# EasyEDA Pro project base-carrier-v0.2.epro

# Schematic Base Carrier

## Sheets
1 Power-External: Board Name: Board1; Create Date: 2026-06-24; Page Name: Power-External; Project Name: ThesadaCore-v1; Schematic Name: CarrierBoard; Update Date: 2026-07-22; Company: EasyEDA.com; Page Size: A4; Version: V1.0
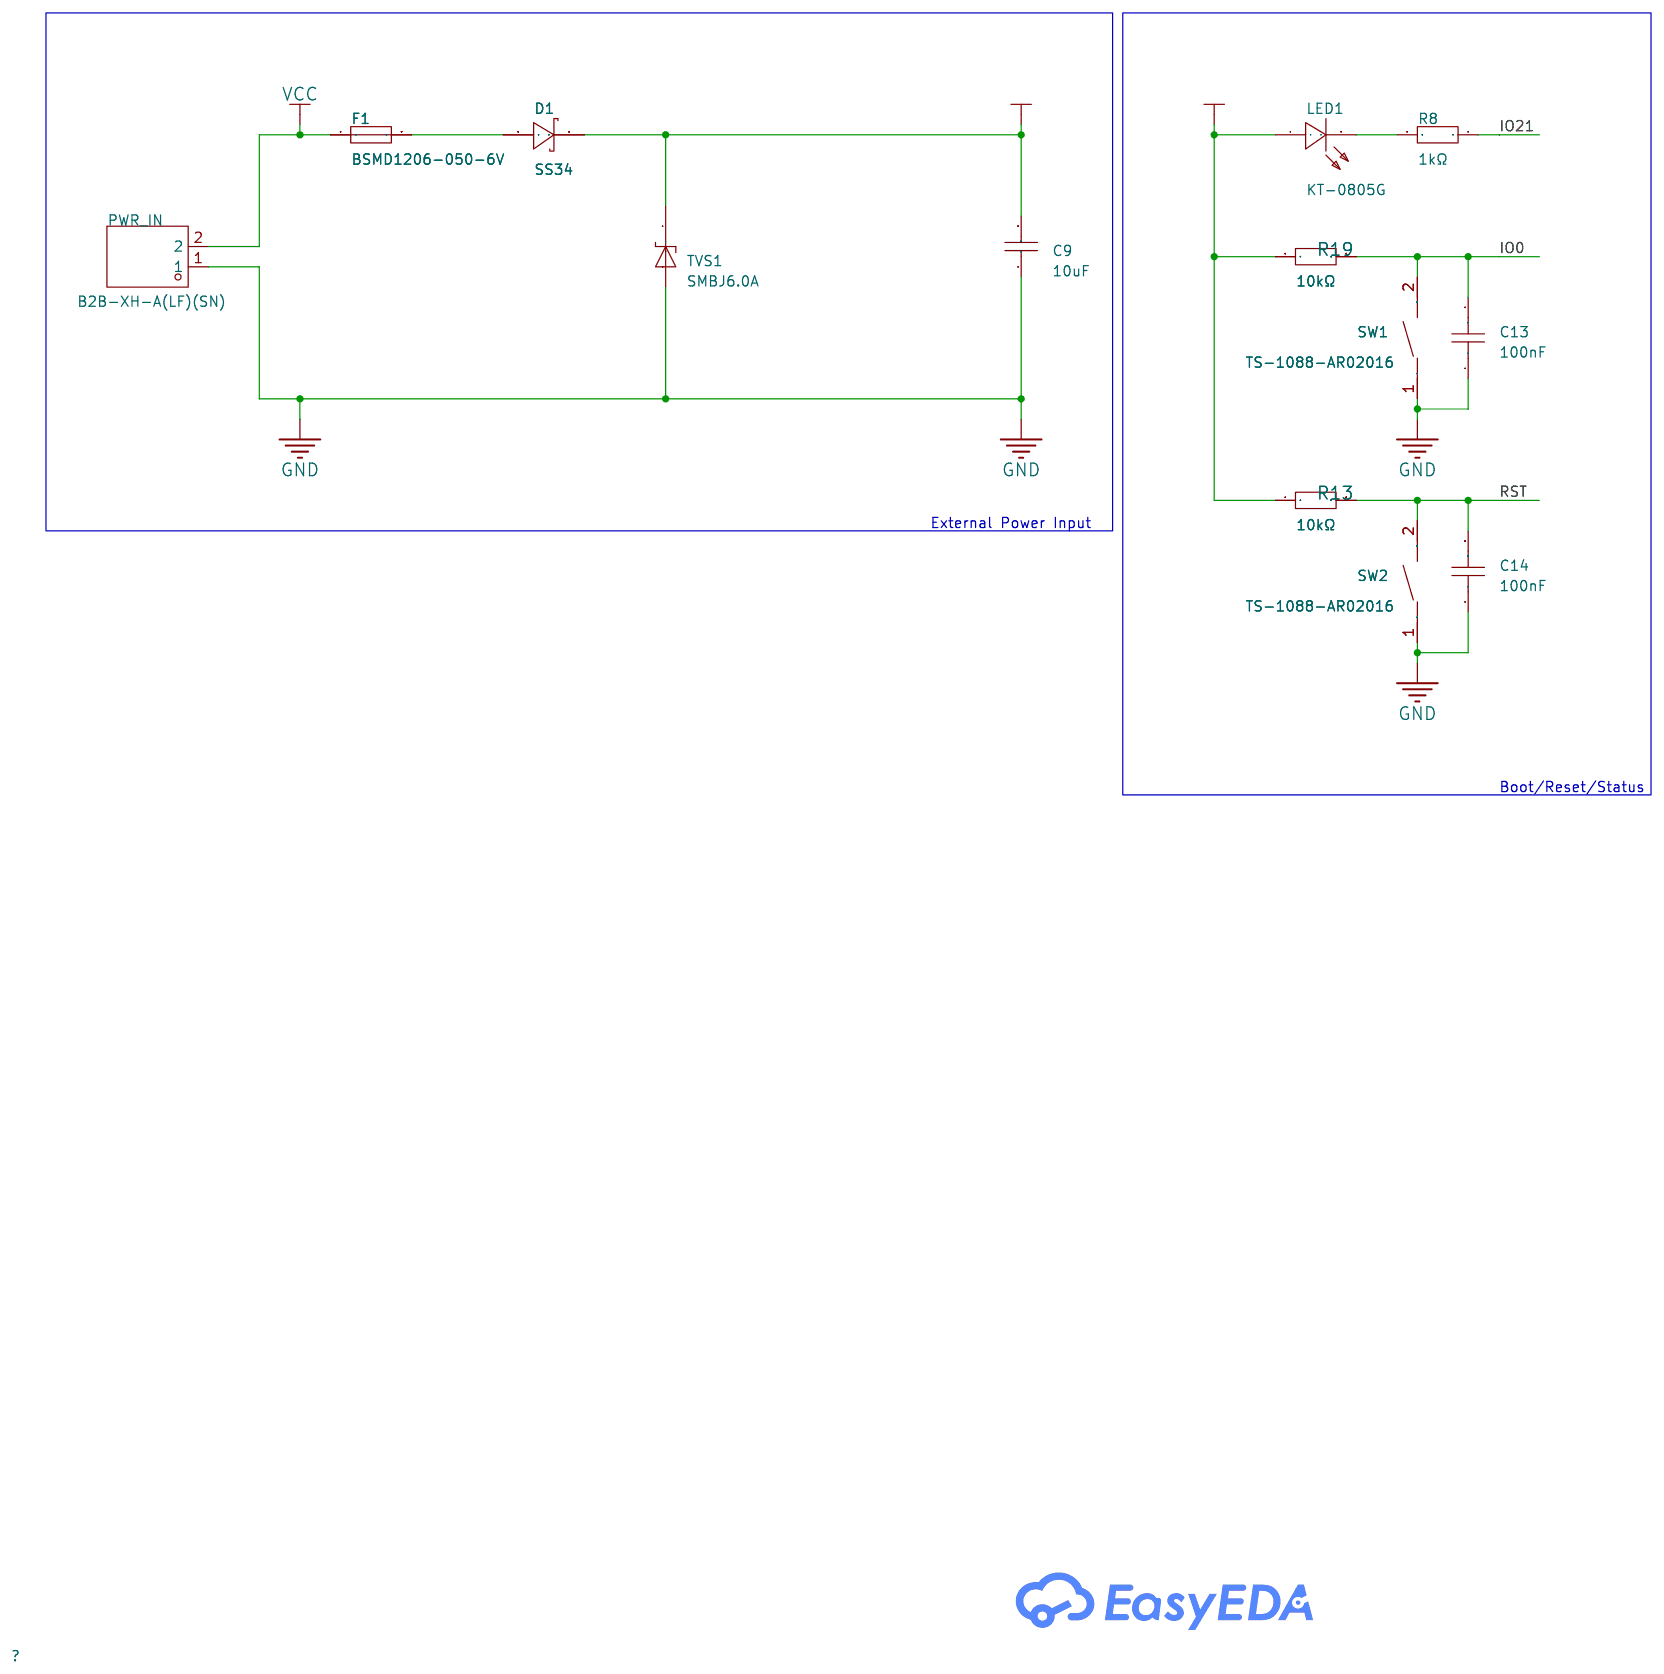
[diagram p0: Power-External]
2 Module-Con: Page Name: Module-Con; Update Date: 2026-07-09
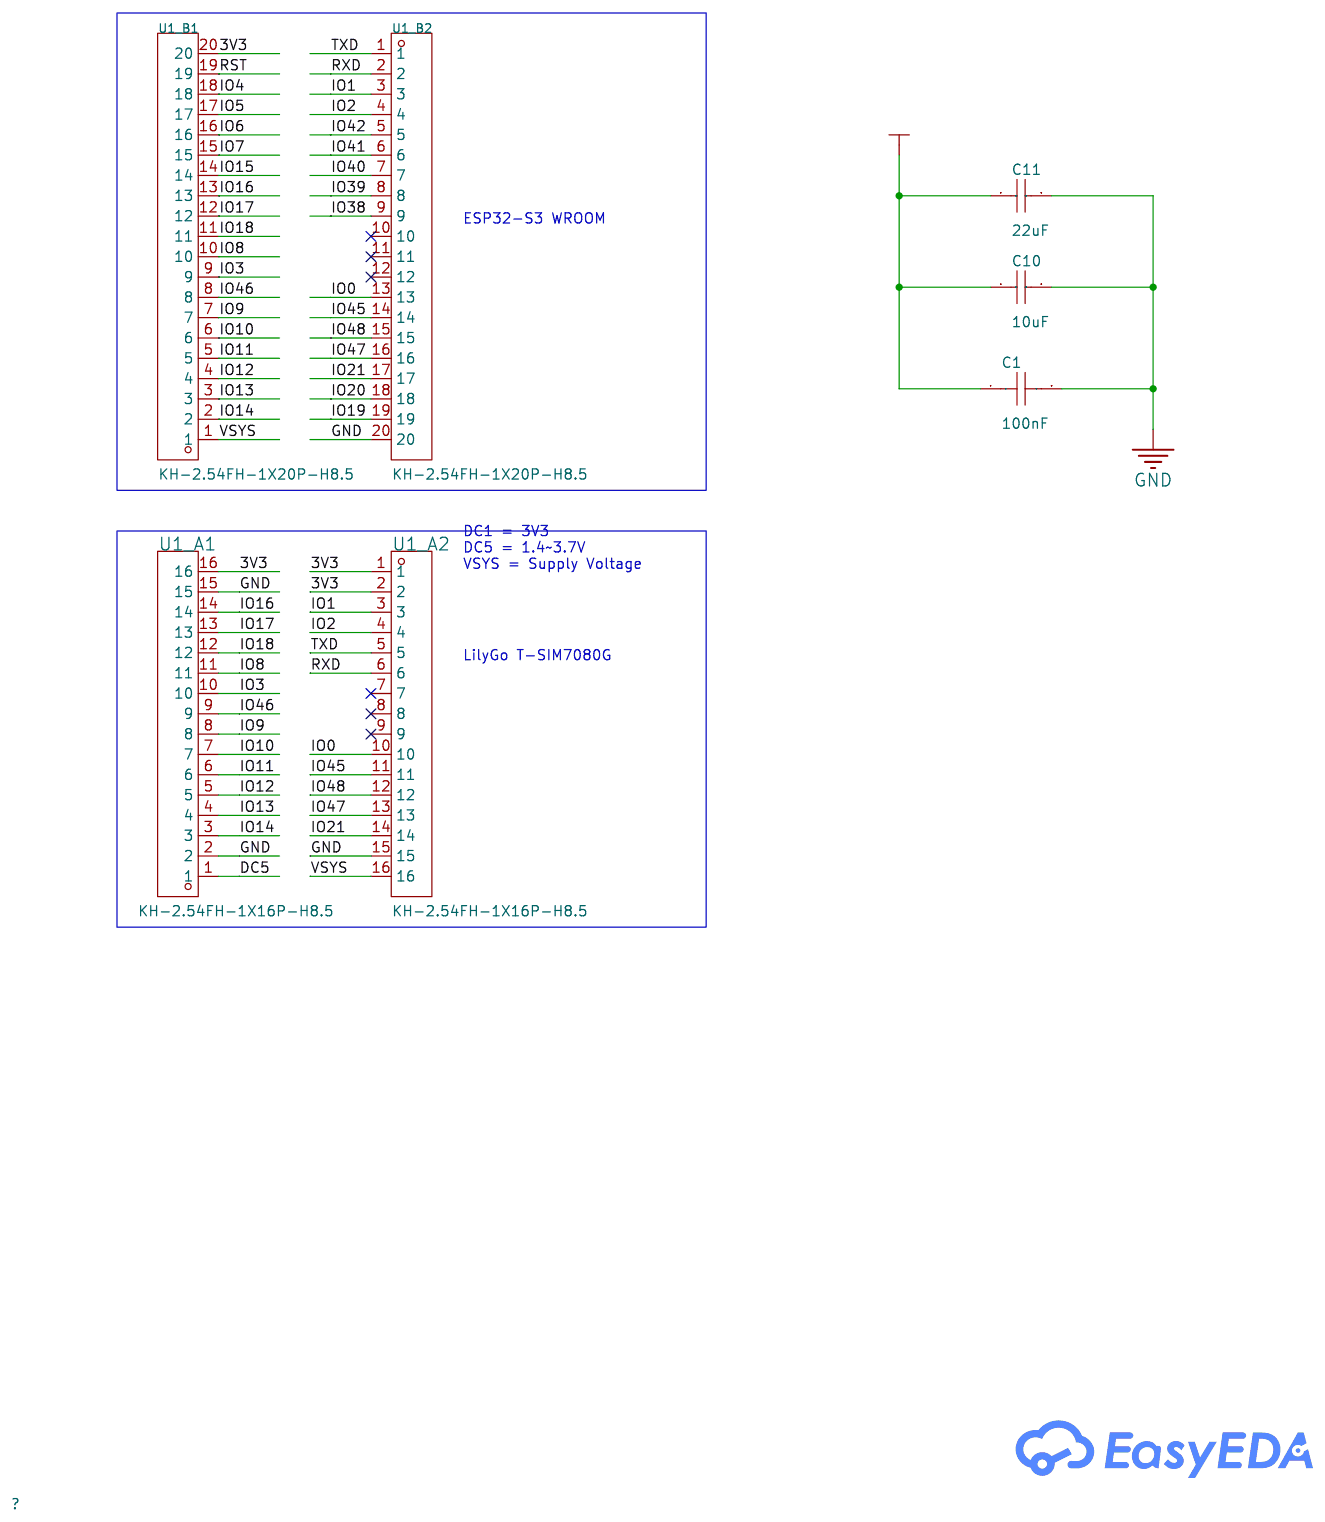
[diagram p1: Module-Con]
3 ADS: Page Name: ADS; Update Date: 2026-06-25
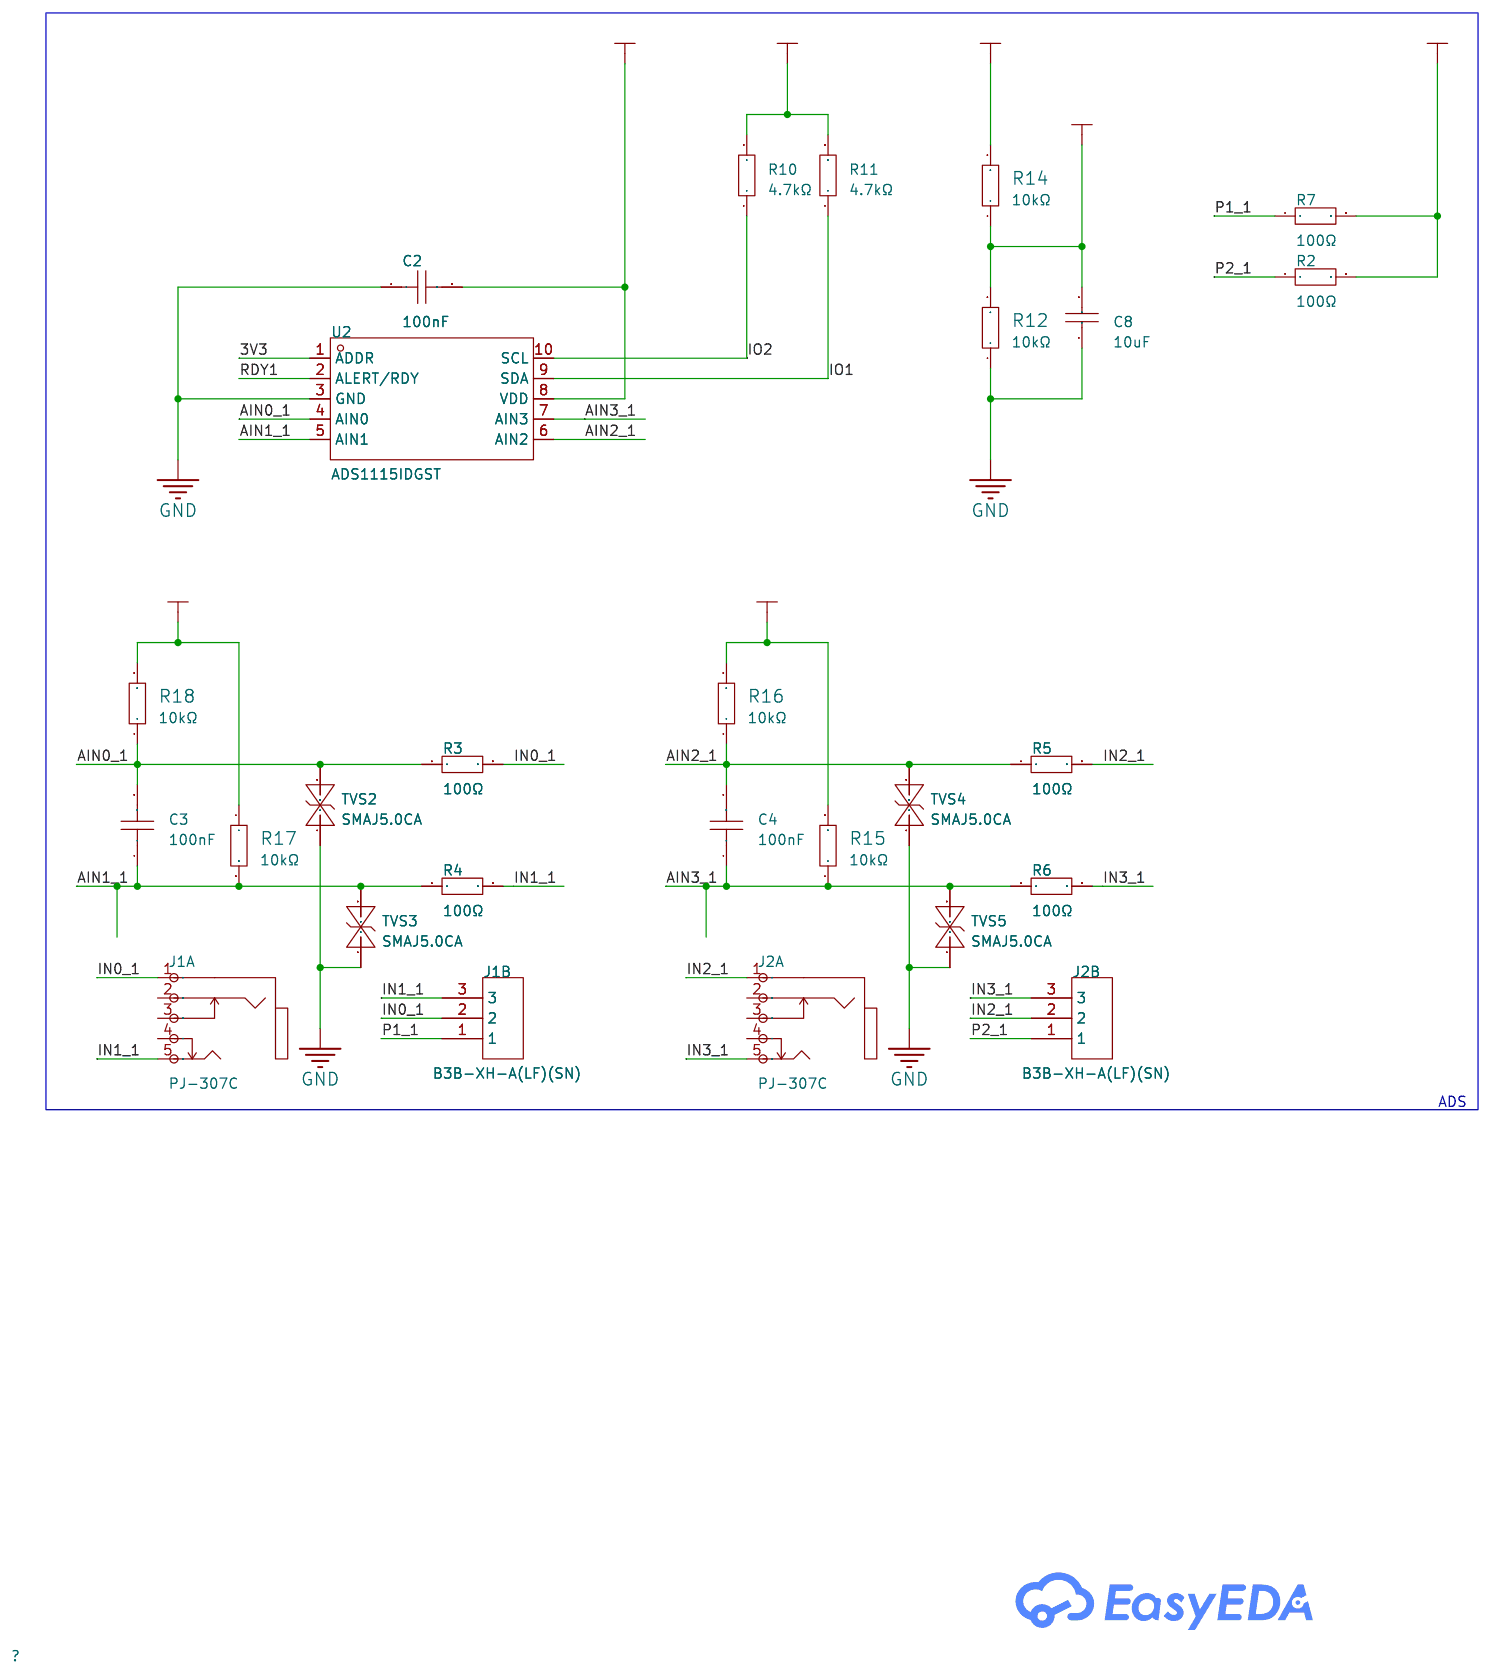
[diagram p2: ADS]
4 1Wire: Page Name: 1Wire_LoRa; Update Date: 2026-06-25
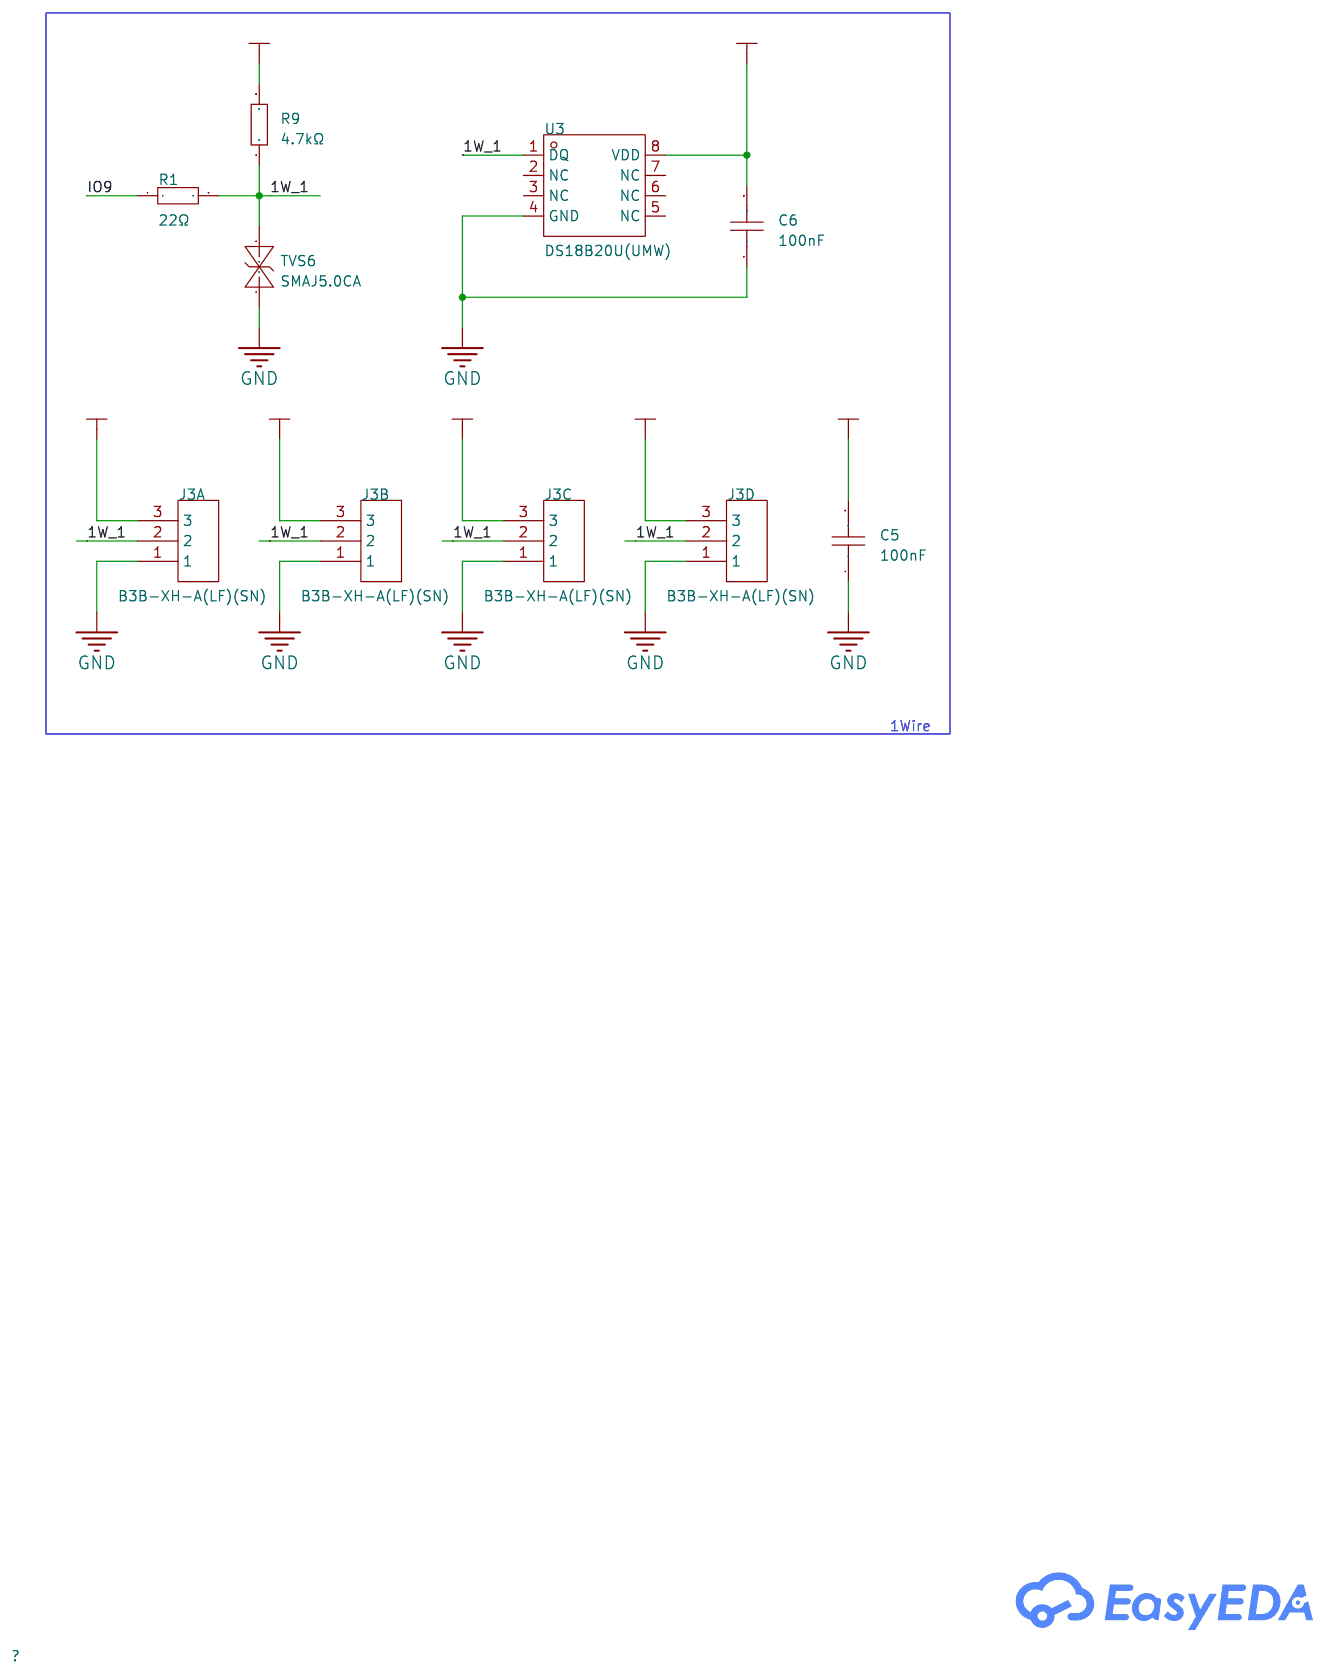
[diagram p3: 1Wire]

## Parts
sheet 1Wire
C5  100nF  [C0603]
C6  100nF  [C0603]
J3A  B3B-XH-A(LF)(SN)  [CONN-TH_3P-P2.50_A2501WV2-3P]
J3B  B3B-XH-A(LF)(SN)  [CONN-TH_3P-P2.50_A2501WV2-3P]
J3C  B3B-XH-A(LF)(SN)  [CONN-TH_3P-P2.50_A2501WV2-3P]
J3D  B3B-XH-A(LF)(SN)  [CONN-TH_3P-P2.50_A2501WV2-3P]
R1  22Ω  [R0603]
R9  4.7kΩ  [R0603]
TVS6  SMAJ5.0CA  [SMA_L4.3-W2.6-LS5.0-BI]
U3  DS18B20U(UMW)  [MSOP-8_L3.0-W3.0-P0.65-LS4.9-BL]
sheet ADS
C2  100nF  [C0603]
C3  100nF  [C0603]
C4  100nF  [C0603]
C8  10uF  [C1206]
J1A  PJ-307C  [AUDIO-TH_PJ307C]
J1B  B3B-XH-A(LF)(SN)  [CONN-TH_3P-P2.50_A2501WV2-3P]  (no BOM)
J2A  PJ-307C  [AUDIO-TH_PJ307C]
J2B  B3B-XH-A(LF)(SN)  [CONN-TH_3P-P2.50_A2501WV2-3P]  (no BOM)
R2  100Ω  [R0603]
R3  100Ω  [R0603]
R4  100Ω  [R0603]
R5  100Ω  [R0603]
R6  100Ω  [R0603]
R7  100Ω  [R0603]
R10  4.7kΩ  [R0603]
R11  4.7kΩ  [R0603]
R12  10kΩ  [R0603]
R14  10kΩ  [R0603]
R15  10kΩ  [R0603]
R16  10kΩ  [R0603]
R17  10kΩ  [R0603]
R18  10kΩ  [R0603]
TVS2  SMAJ5.0CA  [SMA_L4.3-W2.6-LS5.0-BI]
TVS3  SMAJ5.0CA  [SMA_L4.3-W2.6-LS5.0-BI]
TVS4  SMAJ5.0CA  [SMA_L4.3-W2.6-LS5.0-BI]
TVS5  SMAJ5.0CA  [SMA_L4.3-W2.6-LS5.0-BI]
U2  ADS1115IDGST  [VSSOP-10_L3.0-W3.0-P0.50-LS4.9-BL]
sheet Module-Con
C1  100nF  [C0603]
C10  10uF  [C1206]
C11  22uF  [C1206]
U1_A1  KH-2.54FH-1X16P-H8.5  [HDR-TH_16P-P2.54-V-F-B]  (no BOM)
U1_A2  KH-2.54FH-1X16P-H8.5  [HDR-TH_16P-P2.54-V-F-B]  (no BOM)
U1_B1  KH-2.54FH-1X20P-H8.5  [HDR-TH_20P-P2.54-V-F-2]  (no BOM)
U1_B2  KH-2.54FH-1X20P-H8.5  [HDR-TH_20P-P2.54-V-F-2]  (no BOM)
sheet Power-External
C9  10uF  [C1206]
C13  100nF  [C0603]
C14  100nF  [C0603]
D1  SS34  [SMA_L4.3-W2.6-LS5.2-RD]
F1  BSMD1206-050-6V  [F1206]
LED1  KT-0805G  [LED0805-R-RD]
PWR_IN  B2B-XH-A(LF)(SN)  [CONN-TH_B2B-XH-A-LF-SN]  (no BOM)
R8  1kΩ  [R0603]
R13  10kΩ  [R0603]
R19  10kΩ  [R0603]
SW1  TS-1088-AR02016  [SW-SMD_L3.9-W3.0-P4.45]
SW2  TS-1088-AR02016  [SW-SMD_L3.9-W3.0-P4.45]
TVS1  SMBJ6.0A  [SMB_L4.5-W3.7-LS5.4-RD]

## Library data of the parts
C1-C6 C13 C14 = CC0603KRX7R9BB104: Capacitance:100nF Tolerance:±10% Tolerance:±10% Voltage Rating:50V Temperature Coefficient:X7R; LCSC Part Name: 100nF ±10% 50V; Supplier Part: C14663; Manufacturer: YAGEO(国巨); Supplier Footprint: 0603; JLCPCB Part Class: Basic Part; Datasheet: https://item.szlcsc.com/datasheet/CC0603KRX7R9BB104/15331.html; Supplier: LCSC; Tolerance: ±10%; Voltage Rating: 50V; Temperature Coefficient: X7R
J1B J2B J3A J3B J3C J3D = B3B-XH-A(LF)(SN): Pins Structure:1x3P Pitch:2.5mm Mounting Type:Through Hole Reference Series:XH Number of Pins:3P Number of Rows:1 Number of PINs Per Row:3 Row Spacing:- Current Rating:3A Contact Material:Brass Contact Plating:Tin Operating Temperature:-25℃~+85℃ Operating; LCSC Part Name: 1x3P 间距:2.5mm 直插 系列:XH; Supplier Part: C144394; Manufacturer: JST; Supplier Footprint: 插件,P=2.5mm; JLCPCB Part Class: Extended Part; Datasheet: https://item.szlcsc.com/datasheet/B3B-XH-A(LF)(SN)/155726.html; Supplier: LCSC; Pins Structure: 1x3P; Pitch: 2.5mm; Mounting Type: Through Hole; Reference Series: XH; Number of Pins: 3P; Number of Rows: 1; Number of PINs Per Row: 3; Current Rating: 3A; Contact Material: Brass; Contact Plating: Tin; Operating Temperature: -25℃~+85℃; Voltage Rating: 250V; Plastic Material: PA66; Flame Retardant Rating: UL94V-0; Supplementary Features: K Pin; Color: White; Z-Height of the Board: 7mm; X-Length of Bottom Edge on Board (Spacing Line): 9.9mm; Y-Width of Bottom Edge on Board: 5.75mm
R1 = 0603WAF220JT5E: Type:Thick Film Resistors Resistance:22Ω Tolerance:±1% Tolerance:±1% Power(Watts): Overload Voltage (Max): Temperature Coefficient:±100ppm/℃ Temperature Coefficient:±100ppm/℃ Operating Temperature Range:-55℃~+155℃ Operating Temperature Range:-55℃~+155℃; LCSC Part Name: 22Ω ±1% 100mW 厚膜电阻; Supplier Part: C23345; Manufacturer: UNI-ROYAL(厚声); Supplier Footprint: 0603; JLCPCB Part Class: Basic Part; Datasheet: https://atta.szlcsc.com/upload/public/pdf/source/20200306/C422600_1E6D84923E4A46A82E41ADD87F860B5C.pdf; Supplier: LCSC; Type: Thick Film Resistors; Tolerance: ±1%; Temperature Coefficient: ±100ppm/℃; Operating Temperature Range: -55℃~+155℃
R9-R11 = 0603WAF4701T5E: Type:Thick Film Resistor Resistance:4.7kΩ Tolerance:±1% Tolerance:±1% Power(Watts):100mW Voltage-Supply(Max):75V Temperature Coefficient:±100ppm/℃ Temperature Coefficient:±100ppm/℃ Operating Temperature:-55℃~+155℃ Operating Temperature:-55℃~+155℃; LCSC Part Name: 4.7kΩ ±1% 100mW 厚膜电阻; Supplier Part: C23162; Manufacturer: UNI-ROYAL(厚声); Supplier Footprint: 0603; JLCPCB Part Class: Basic Part; Datasheet: https://item.szlcsc.com/datasheet/0603WAF4701T5E/23889.html; Supplier: LCSC; Type: Thick Film Resistor; Tolerance: ±1%; Power(Watts): 100mW; Voltage-Supply(Max): 75V; Temperature Coefficient: ±100ppm/℃; Operating Temperature: -55℃~+155℃
TVS2-TVS6 = SMAJ5.0CA_C19077524: Polarity:Bidirectional Reverse Stand-Off Voltage (Vrwm):5V Clamping Voltage:9.2V Peak Pulse Current (Ipp):43.5A@10/1000us Peak Pulse Power Dissipation (Ppp):400W@10/1000us Voltage - Breakdown:7V Reverse Leakage Current (Ir):800uA Number of Channels:1 Oper; LCSC Part Name: 双向TVS 5V截止 峰值浪涌电流：43.5A@10/1000us; Supplier Part: C19077524; Manufacturer: R+O(宏嘉诚); Supplier Footprint: DO-214AC(SMA); JLCPCB Part Class: Extended Part; Datasheet: https://item.szlcsc.com/datasheet/SMAJ5.0CA/20275609.html; Supplier: LCSC; Polarity: Bidirectional; Reverse Stand-Off Voltage (Vrwm): 5V; Clamping Voltage: 9.2V; Peak Pulse Current (Ipp): 43.5A@10/1000us; Peak Pulse Power Dissipation (Ppp): 400W@10/1000us; Voltage - Breakdown: 7V; Reverse Leakage Current (Ir): 800uA; Number of Channels: 1; Operating Temperature: -55℃~+150℃; level of protection: IEC 61000-4-2; Type: TVS
U3 = DS18B20U(UMW): Detection Temperature Range:-55℃~+125℃ Detection Temperature Range:-55℃~+125℃ Tolerance:±0.4℃ Tolerance:±0.4℃ Voltage - Supply:2.5V~5.5V Voltage - Supply:2.5V~5.5V Standby Current:750nA Interface:Single-bus Temperature Conversion Time:400ms Temperature Re; LCSC Part Name: 温度传感器; Supplier Part: C695836; Manufacturer: UMW(友台半导体); Supplier Footprint: MSOP-8; JLCPCB Part Class: Extended Part; Datasheet: https://item.szlcsc.com/datasheet/DS18B20U(UMW)/729486.html; Supplier: LCSC; Detection Temperature Range: -55℃~+125℃; Tolerance: ±0.4℃; Voltage - Supply: 2.5V~5.5V; Standby Current: 750nA; Interface: Single-bus; Temperature Conversion Time: 400ms; Temperature Resolution: 12bit
C8-C10 = CL31A106KBHNNNE: Capacitance:10uF Tolerance:±10% Tolerance:±10% Voltage Rating:50V Temperature Coefficient:X5R; LCSC Part Name: 10uF ±10% 50V; Supplier Part: C13585; Manufacturer: SAMSUNG(三星); Supplier Footprint: 1206; JLCPCB Part Class: Basic Part; Datasheet: https://item.szlcsc.com/datasheet/CL31A106KBHNNNE/14236.html; Supplier: LCSC; Tolerance: ±10%; Voltage Rating: 50V; Temperature Coefficient: X5R
J1A J2A = PJ-307C: Connector Type:3.5mm Headphone Jack Current Rating:500mA Voltage Rating (Max):30V Operating Temperature:-30℃~+70℃ Operating Temperature:-30℃~+70℃; LCSC Part Name: 3.5mm耳机座; Supplier Part: C16684; Manufacturer: BOOMELE(博穆精密); Supplier Footprint: 插件; JLCPCB Part Class: Extended Part; Datasheet: https://item.szlcsc.com/datasheet/PJ-307C/17367.html; Supplier: LCSC; Connector Type: 3.5mm Headphone Jack; Current Rating: 500mA; Voltage Rating (Max): 30V; Operating Temperature: -30℃~+70℃
R2-R7 = 0603WAF1000T5E: Type:Thick Film Resistors Resistance: Tolerance:±1% Tolerance:±1% Power(Watts): Overload Voltage (Max): Temperature Coefficient:±200ppm/℃ Temperature Coefficient:±200ppm/℃ Operating Temperature Range:-55℃~+155℃ Operating Temperature Range:-55℃~+155℃; LCSC Part Name: 100Ω ±1% 100mW 厚膜电阻; Supplier Part: C22775; Manufacturer: UNI-ROYAL(厚声); Supplier Footprint: 0603; JLCPCB Part Class: Basic Part; Datasheet: https://atta.szlcsc.com/upload/public/pdf/source/20200306/C422600_1E6D84923E4A46A82E41ADD87F860B5C.pdf; Supplier: LCSC; Type: Thick Film Resistors; Tolerance: ±1%; Temperature Coefficient: ±200ppm/℃; Operating Temperature Range: -55℃~+155℃
R12-R19 = 0603WAF1002T5E: Type:Thick Film Resistor Resistance:10kΩ Tolerance:±1% Tolerance:±1% Power(Watts):100mW Voltage-Supply(Max):75V Temperature Coefficient:±100ppm/℃ Temperature Coefficient:±100ppm/℃ Operating Temperature:-55℃~+155℃ Operating Temperature:-55℃~+155℃; LCSC Part Name: 厚膜电阻 10kΩ ±1% 100mW; Supplier Part: C25804; Manufacturer: UNI-ROYAL(厚声); Supplier Footprint: 0603; JLCPCB Part Class: Basic Part; Datasheet: https://item.szlcsc.com/datasheet/0603WAF1002T5E/26547.html; Supplier: LCSC; Type: Thick Film Resistor; Tolerance: ±1%; Power(Watts): 100mW; Voltage-Supply(Max): 75V; Temperature Coefficient: ±100ppm/℃; Operating Temperature: -55℃~+155℃
U2 = ADS1115IDGST: Resolution(Bits):16 Sampling Rate:860Hz number of channels:2；4 Voltage - Supply:2V~5.5V Voltage - Supply:2V~5.5V Interface:I2C differential input:Yes Integral non - linearity:1LSB Integral non - linearity:1LSB Operating Temperature:-40℃~+125℃ Operating Te; LCSC Part Name: 具有内部基准、振荡器和可编程比较器且兼容 I2C 的ADS111x、超小型、低功耗 860SPS、16位ADC; Supplier Part: C468683; Manufacturer: TI(德州仪器); Supplier Footprint: VSSOP-10-0.5mm; JLCPCB Part Class: Extended Part; Datasheet: https://www.ti.com/cn/lit/gpn/ads1113; Supplier: LCSC; Resolution(Bits): 16; Sampling Rate: 860Hz; number of channels: 2；4; Voltage - Supply: 2V~5.5V; Interface: I2C; differential input: Yes; Integral non - linearity: 1LSB; Operating Temperature: -40℃~+125℃; Clock/Oscillator: Built-in; Clock Frequency: 1MHz; Voltage Reference: Built-in; Voltage Reference Drift: 5ppm/℃; Programmable Gain: Support; ADC architecture: Sigma-Delta; Data rate: 128Hz；8Hz；64Hz；16Hz；32Hz；250Hz；475Hz；860Hz; Quiescent Current (Iq): 2uA; Full-Scale Range(FSR): 6.144V
C11 = CL31A226KAHNNNE: Capacitance:22uF Tolerance:±10% Tolerance:±10% Voltage Rating:25V Temperature Coefficient:X5R; LCSC Part Name: 22uF ±10% 25V; Supplier Part: C12891; Manufacturer: SAMSUNG(三星); Supplier Footprint: 1206; JLCPCB Part Class: Basic Part; Datasheet: https://item.szlcsc.com/datasheet/CL31A226KAHNNNE/13537.html; Supplier: LCSC; Tolerance: ±10%; Voltage Rating: 25V; Temperature Coefficient: X5R
U1_A1 U1_A2 = KH-2.54FH-1X16P-H8.5: Holes Structure:1x16P Pitch:2.54mm Row Spacing:- Circular Hole / Square Hole:Square Hole Mounting Type:Through Hole Number of Rows:1 Number of Positions:16P Current Rating:3A Voltage Rating (Max):- Holes Direction:Top Insulation Height:8.5mm Operating Tem; LCSC Part Name: 间距:2.54mm 1x16P 直插; Supplier Part: C2905421; Manufacturer: kinghelm(金航标); Supplier Footprint: 插件,P=2.54mm; JLCPCB Part Class: Extended Part; Datasheet: https://item.szlcsc.com/datasheet/KH-2.54FH-1X16P-H8.5/3175195.html; Supplier: LCSC; Holes Structure: 1x16P; Pitch: 2.54mm; Circular Hole / Square Hole: Square Hole; Mounting Type: Through Hole; Number of Rows: 1; Number of Positions: 16P; Current Rating: 3A; Holes Direction: Top; Insulation Height: 8.5mm; Operating Temperature: -40℃~+105℃
U1_B1 U1_B2 = KH-2.54FH-1X20P-H8.5: Holes Structure:1x20P Pitch:2.54mm Row Spacing:- Circular Hole / Square Hole:Square Hole Mounting Type:Through Hole Number of Rows:1 Number of Positions:20P Current Rating:3A Voltage Rating (Max):- Holes Direction:Top Insulation Height:8.5mm Operating Tem; LCSC Part Name: 间距:2.54mm 1x20P 直插; Supplier Part: C2905423; Manufacturer: kinghelm(金航标); Supplier Footprint: 插件,P=2.54mm; JLCPCB Part Class: Extended Part; Datasheet: https://item.szlcsc.com/datasheet/KH-2.54FH-1X20P-H8.5/3175197.html; Supplier: LCSC; Holes Structure: 1x20P; Pitch: 2.54mm; Circular Hole / Square Hole: Square Hole; Mounting Type: Through Hole; Number of Rows: 1; Number of Positions: 20P; Current Rating: 3A; Holes Direction: Top; Insulation Height: 8.5mm; Operating Temperature: -40℃~+105℃
D1 = SS34_C8678: Diode Configuration:Independent Voltage - Forward(Vf@If):550mV@3A Voltage - DC Reverse(Vr):40V Current - Rectified:3A Reverse Leakage Current (Ir):500uA@40V Operating Junction Temperature Range:-55℃~+125℃ Operating Junction Temperature Range:-55℃~+125℃; LCSC Part Name: 电压:40V 电流:3A; Supplier Part: C8678; Manufacturer: MDD(辰达半导体); Supplier Footprint: SMA(DO-214AC); JLCPCB Part Class: Basic Part; Datasheet: https://item.szlcsc.com/datasheet/SS34/9178.html; Supplier: LCSC; Diode Configuration: Independent; Voltage - Forward(Vf@If): 550mV@3A; Voltage - DC Reverse(Vr): 40V; Current - Rectified: 3A; Reverse Leakage Current (Ir): 500uA@40V; Operating Junction Temperature Range: -55℃~+125℃
F1 = BSMD1206-050-6V: Voltage - Max:6V Current - Max:100A Hold Current:500mA Trip Current:1A Power Dissipation:600mW Resistance - Initial (Ri) (Min):150mΩ Resistance - Post Trip (R1) (Max):700mΩ Time to Trip(Max):100ms Operating Temperature:-40℃~+85℃ Operating Temperature:-40℃; LCSC Part Name: 6V 500mA 1206自恢复; Supplier Part: C883122; Manufacturer: BHFUSE(佰宏); Supplier Footprint: 1206; JLCPCB Part Class: Extended Part; Supplier: LCSC; Voltage - Max: 6V; Current - Max: 100A; Hold Current: 500mA; Trip Current: 1A; Power Dissipation: 600mW; Resistance - Initial (Ri) (Min): 150mΩ; Resistance - Post Trip (R1) (Max): 700mΩ; Time to Trip(Max): 100ms; Operating Temperature: -40℃~+85℃; Length: 3.6mm; Width: 1.9mm; Height: 1mm
LED1 = KT-0805G: Lamp Holder Type:- Illumination Color:Emerald Green Voltage - Forward(Vf):2.6V~3.1V Voltage - Forward(Vf):2.6V~3.1V Power(Watts):100mW Forward Current:5mA Wavelength - Dominant:513nm~528nm Wavelength - Dominant:513nm~528nm Peak Wavelength:525nm Diode Conf; LCSC Part Name: 0805 翠绿 高亮; Supplier Part: C2297; Manufacturer: KENTO; Supplier Footprint: 0805; JLCPCB Part Class: Basic Part; Datasheet: https://item.szlcsc.com/datasheet/KT-0805G/2670.html; Supplier: LCSC; Illumination Color: Emerald Green; Voltage - Forward(Vf): 2.6V~3.1V; Power(Watts): 100mW; Forward Current: 5mA; Wavelength - Dominant: 513nm~528nm; Peak Wavelength: 525nm; Diode Configuration: Discrete Diode; Lens Color: Water Clear; Luminous Intensity: 430mcd; Viewing Angle: 120°; Operating Temperature: -40℃~+85℃
PWR_IN = B2B-XH-A(LF)(SN): Pins Structure:1x2P Pitch:2.5mm Mounting Type:Through Hole Reference Series:XH Number of Pins:2P Number of Rows:1 Number of PINs Per Row:2 Row Spacing:- Current Rating:3A Contact Material:Brass Contact Plating:Tin Operating Temperature:-25℃~+85℃ Operating; LCSC Part Name: 1x2P 间距:2.5mm 直插 系列:XH; Supplier Part: C158012; Manufacturer: JST; Supplier Footprint: 插件,P=2.5mm; JLCPCB Part Class: Extended Part; Datasheet: https://item.szlcsc.com/datasheet/B2B-XH-A(LF)(SN)/169360.html; Supplier: LCSC; Pins Structure: 1x2P; Pitch: 2.5mm; Mounting Type: Through Hole; Reference Series: XH; Number of Pins: 2P; Number of Rows: 1; Number of PINs Per Row: 2; Current Rating: 3A; Contact Material: Brass; Contact Plating: Tin; Operating Temperature: -25℃~+85℃; Voltage Rating: 250V; Plastic Material: PA66; Flame Retardant Rating: UL94V-0; Supplementary Features: K Pin; Color: White; Z-Height of the Board: 7mm; X-Length of Bottom Edge on Board (Spacing Line): 7.4mm; Y-Width of Bottom Edge on Board: 5.75mm
R8 = 0603WAF1001T5E: Type:Thick Film Resistor Resistance:1kΩ Tolerance:±1% Tolerance:±1% Power(Watts):100mW Voltage-Supply(Max):75V Temperature Coefficient:±100ppm/℃ Temperature Coefficient:±100ppm/℃ Operating Temperature:-55℃~+155℃ Operating Temperature:-55℃~+155℃; LCSC Part Name: 1kΩ ±1% 100mW 厚膜电阻; Supplier Part: C21190; Manufacturer: UNI-ROYAL(厚声); Supplier Footprint: 0603; JLCPCB Part Class: Basic Part; Datasheet: https://item.szlcsc.com/datasheet/0603WAF1001T5E/21904.html; Supplier: LCSC; Type: Thick Film Resistor; Tolerance: ±1%; Power(Watts): 100mW; Voltage-Supply(Max): 75V; Temperature Coefficient: ±100ppm/℃; Operating Temperature: -55℃~+155℃
SW1 SW2 = TS-1088-AR02016: Circuit:SPST Actuator Style:Round Button Operating Force:1.6N Mounting Type:Surface Mount,Vertical Length:4mm Width:3mm Switch Height:2mm with Bracket:Without Bracket Contact Current:50mA Voltage Rating:12V Actuator/Cap Color:Black Termination Style:SMD(S; LCSC Part Name: 4*3*2mm 立贴 轻触开关; Supplier Part: C720477; Manufacturer: XUNPU(讯普); Supplier Footprint: SMD,4x3mm; JLCPCB Part Class: Basic Part; Datasheet: https://item.szlcsc.com/datasheet/TS-1088-AR02016/763484.html; Supplier: LCSC; Circuit: SPST; Actuator Style: Round Button; Operating Force: 1.6N; Mounting Type: Surface Mount,Vertical; Length: 4mm; Width: 3mm; Switch Height: 2mm; with Bracket: Without Bracket; Contact Current: 50mA; Voltage Rating: 12V; Actuator/Cap Color: Black; Termination Style: SMD(SMT) Tab; Life: 100,000 Cycles; Operating Temperature: -30℃~+80℃
TVS1 = SMBJ6.0A_C3001967: Polarity:Bidirectional Reverse Stand-Off Voltage (Vrwm):6V Clamping Voltage:10.3V Peak Pulse Current (Ipp):58.3A Peak Pulse Power Dissipation (Ppp):600W Voltage - Breakdown:6.67V Reverse Leakage Current (Ir):800uA level of protection:IEC 61000-4-4；IEC 610; Supplier Part: C3001967; Manufacturer: UMW(友台半导体); Supplier Footprint: SMB; JLCPCB Part Class: Extended Part; Datasheet: https://item.szlcsc.com/datasheet/SMBJ6.0A/3486674.html; Supplier: LCSC; Polarity: Bidirectional; Reverse Stand-Off Voltage (Vrwm): 6V; Clamping Voltage: 10.3V; Peak Pulse Current (Ipp): 58.3A; Peak Pulse Power Dissipation (Ppp): 600W; Voltage - Breakdown: 6.67V; Reverse Leakage Current (Ir): 800uA; level of protection: IEC 61000-4-4；IEC 61000-4-2; Type: TVS

## Nets
3V3: C1.1 C2.2 C5.2 C6.2 C10.1 C11.1 J3A.3 J3B.3 J3C.3 J3D.3 LED1.1(A) R2.2 R7.2 R9.2 R10.2 R11.2 R13.1 R14.2 R19.1 U1_A1.16 U1_A2.1 U1_A2.2 U1_B1.20 U2.1(ADDR) U2.8(VDD) U3.8(VDD)
GND: C1.2 C2.1 C5.1 C6.1 C8.1 C9.1 C10.2 C11.2 C13.1 C14.1 J3A.1 J3B.1 J3C.1 J3D.1 PWR_IN.1 R12.1 SW1.1 SW2.1 TVS1.2(A) TVS2.1 TVS3.1 TVS4.1 TVS5.1 TVS6.1 U1_A1.2 U1_A1.15 U1_A2.15 U1_B2.20 U2.3(GND) U3.4(GND)
VCC: F1.1 PWR_IN.2
1W_1: J3A.2 J3B.2 J3C.2 J3D.2 R1.2 R9.1 TVS6.2 U3.1(DQ)
AIN0_1: C3.2 R3.1 R18.1 TVS2.2 U2.4(AIN0)
AIN1_1: C3.1 R4.1 R17.2 TVS3.2 U2.5(AIN1)
AIN2_1: C4.2 R5.1 R16.1 TVS4.2 U2.6(AIN2)
AIN3_1: C4.1 R6.1 R15.1 TVS5.2 U2.7(AIN3)
DC5: U1_A1.1
IN0_1: J1A.1 J1B.2 R3.2
IN1_1: J1A.5 J1B.3 R4.2
IN2_1: J2A.1 J2B.2 R5.2
IN3_1: J2A.5 J2B.3 R6.2
IO0: C13.2 R19.2 SW1.2 U1_A2.10 U1_B2.13
IO1: R11.1 U1_A2.3 U1_B2.3 U2.9(SDA)
IO2: R10.1 U1_A2.4 U1_B2.4 U2.10(SCL)
IO3: U1_A1.10 U1_B1.9
IO4: U1_B1.18
IO5: U1_B1.17
IO6: U1_B1.16
IO7: U1_B1.15
IO8: U1_A1.11 U1_B1.10
IO9: R1.1 U1_A1.8 U1_B1.7
IO10: U1_A1.7 U1_B1.6
IO11: U1_A1.6 U1_B1.5
IO12: U1_A1.5 U1_B1.4
IO13: U1_A1.4 U1_B1.3
IO14: U1_A1.3 U1_B1.2
IO15: U1_B1.14
IO16: U1_A1.14 U1_B1.13
IO17: U1_A1.13 U1_B1.12
IO18: U1_A1.12 U1_B1.11
IO19: U1_B2.19
IO20: U1_B2.18
IO21: R8.1 U1_A2.14 U1_B2.17
IO38: U1_B2.9
IO39: U1_B2.8
IO40: U1_B2.7
IO41: U1_B2.6
IO42: U1_B2.5
IO45: U1_A2.11 U1_B2.14
IO46: U1_A1.9 U1_B1.8
IO47: U1_A2.13 U1_B2.16
IO48: U1_A2.12 U1_B2.15
P1_1: J1B.1 R7.1
P2_1: J2B.1 R2.1
RDY1: U2.2(ALERT/RDY)
RST: C14.2 R13.2 SW2.2 U1_B1.19
RXD: U1_A2.6 U1_B2.2
TXD: U1_A2.5 U1_B2.1
VMID: C8.2 R12.2 R14.1 R15.2 R16.2 R17.1 R18.2
VSYS: C9.2 D1.1(K) TVS1.1(K) U1_A2.16 U1_B1.1
$1N10138: D1.2(A) F1.2
$1N10539: LED1.2(K) R8.2

Not connected (* = marked no-connect by the designer): J1A 2 3 4; J2A 2 3 4; U1_A2 7* 8* 9*; U1_B2 10* 11* 12*; U3 2(NC) 3(NC) 5(NC) 6(NC) 7(NC)

## Notes on the sheets
sheet 1
- External Power Input
- Boot/Reset/Status
sheet 2
- ESP32-S3 WROOM
- DC1 = 3V3
  DC5 = 1.4~3.7V
  VSYS = Supply Voltage
- LilyGo T-SIM7080G
sheet 3
- ADS
sheet 4
- 1Wire

# Board Base Carrier
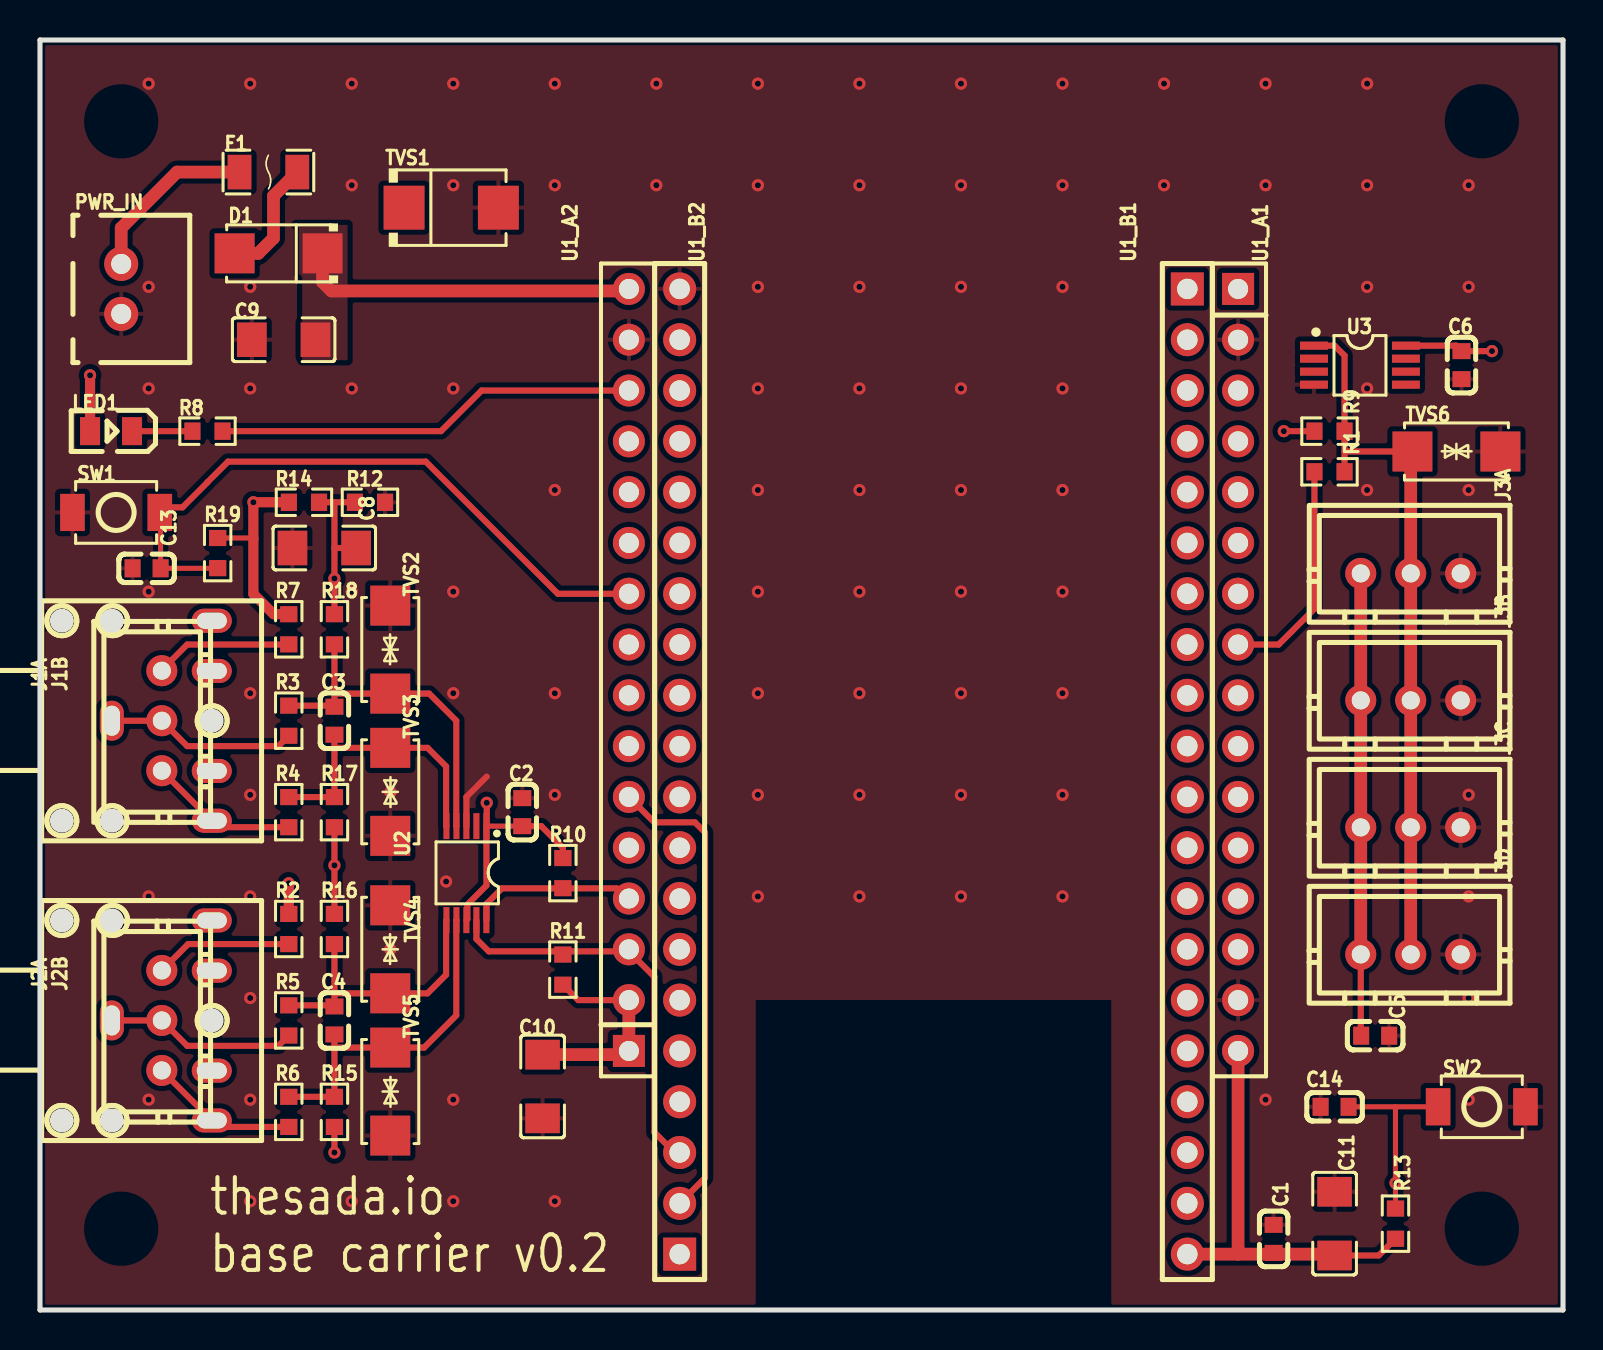
[diagram p4: board, top side]
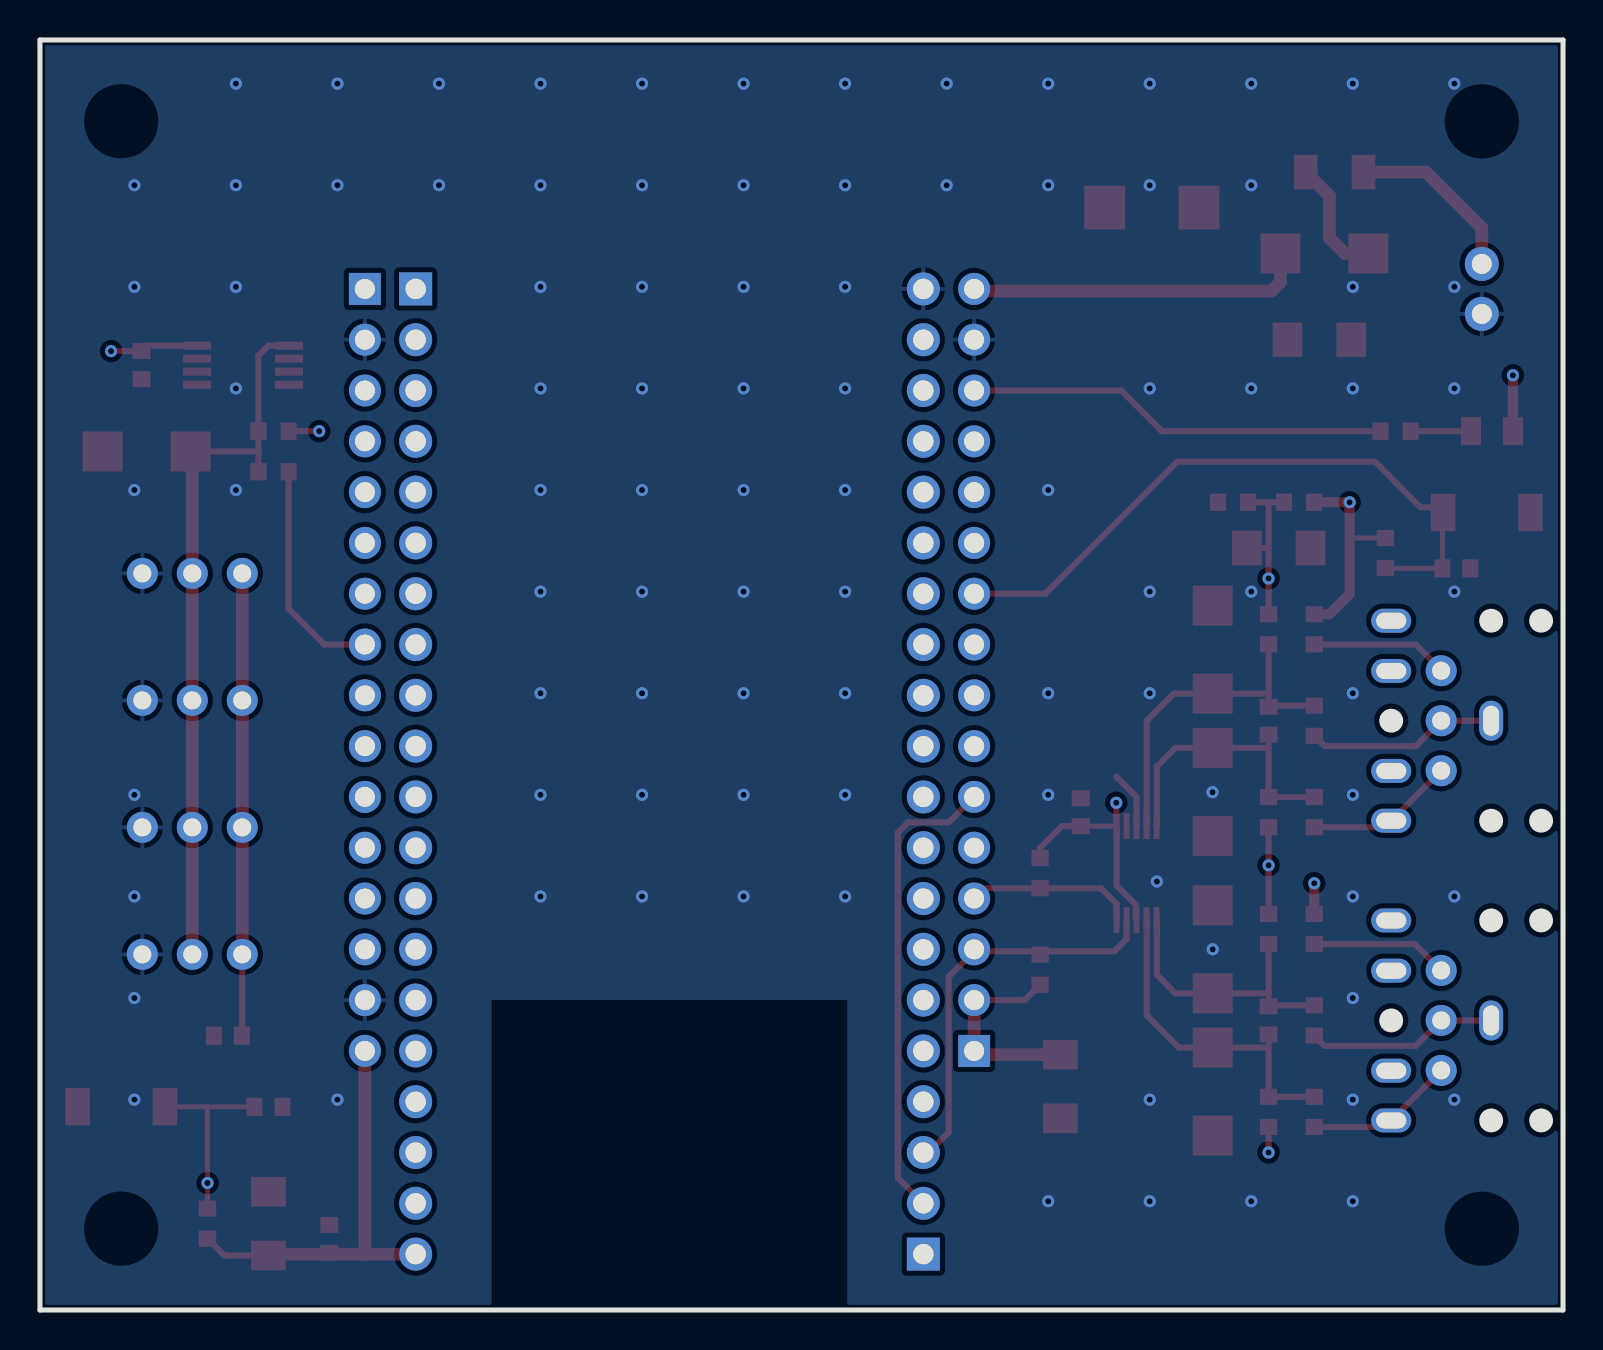
[diagram p5: board, bottom side, seen from below]

Outline 76.2 x 63.5 mm; copper layers: Top Layer, Inner1, Inner2, Bottom Layer. Coordinates in mm from the lower left corner of the outline.
Outline path: 0,63.5 0,0 76.2,0 76.2,63.5 0,63.5
Stack: Top Layer 0.035mm Outer layer thickness 1oz / Dielectric1 0.2104mm 7628 RC49% 8.6mil / Inner1 0.0152mm Inner layer thickness / Dielectric2 1.065mm 1.1mm H/HOZ Copper / Inner2 0.0152mm Inner layer thickness / Dielectric3 0.2104mm 7628 RC49% 8.6mil / Bottom Layer 0.035mm Outer layer thickness 1oz

## Design rules (mm)
template: JLCPCB Capability(Multiple Layers Board)
spacing copperThickness1oz (default): track to track 0.102, other pairs 0.152 to 0.3
spacing copperThickness2oz: track to track 0.203, other pairs 0.152 to 0.3
spacing copperThicknessInner0.5oz: track to track 0.089, other pairs 0.152 to 0.3
track width copperThickness1oz (default): min 0.102, default 0.254, max 2.54
track width copperThickness2oz: min 0.203, default 0.254, max 2.54
track width copperThickness0.5oz: min 0.089, default 0.254, max 2.54
differential pair differentialPair (default): width min 0.127, default 0.254, max 2.54; gap min 0.152, default 0.152
via viaSize (default): diameter min 0.3, default 0.61, max 10; hole min 0.2, default 0.305, max 6.3

## Placement (name value [footprint] x y rotation side)
C1  100nF  [C0603]  61.72 3.56 90 top
C2  100nF  [C0603]  24.13 24.89 270 top
C3  100nF  [C0603]  14.73 29.46 90 top
C4  100nF  [C0603]  14.73 14.48 90 top
C5  100nF  [C0603]  66.8 13.72 180 top
C6  100nF  [C0603]  71.12 47.24 90 top
C8  10uF  [C1206]  14.22 38.1 0 top
C9  10uF  [C1206]  12.19 48.51 0 top
C10  10uF  [C1206]  25.15 11.18 270 top
C11  22uF  [C1206]  64.77 4.32 90 top
C13  100nF  [C0603]  5.33 37.08 0 top
C14  100nF  [C0603]  64.77 10.16 0 top
D1  SS34  [SMA_L4.3-W2.6-LS5.2-RD]  11.94 52.83 180 top
F1  BSMD1206-050-6V  [F1206]  11.43 56.9 0 top
J1A  PJ-307C  [AUDIO-TH_PJ307C]  6.1 29.46 90 top
J1B  B3B-XH-A(LF)(SN)  [CONN-TH_3P-P2.50_A2501WV2-3P]  6.1 29.46 270 top
J2A  PJ-307C  [AUDIO-TH_PJ307C]  6.1 14.48 90 top
J2B  B3B-XH-A(LF)(SN)  [CONN-TH_3P-P2.50_A2501WV2-3P]  6.1 14.48 270 top
J3A  B3B-XH-A(LF)(SN)  [CONN-TH_3P-P2.50_A2501WV2-3P]  68.58 36.83 180 top
J3B  B3B-XH-A(LF)(SN)  [CONN-TH_3P-P2.50_A2501WV2-3P]  68.58 30.48 180 top
J3C  B3B-XH-A(LF)(SN)  [CONN-TH_3P-P2.50_A2501WV2-3P]  68.58 24.13 180 top
J3D  B3B-XH-A(LF)(SN)  [CONN-TH_3P-P2.50_A2501WV2-3P]  68.58 17.78 180 top
LED1  KT-0805G  [LED0805-R-RD]  3.56 43.94 180 top
NOREF  -  [Pad_e360]  59.94 51.05 0 top
PWR_IN  B2B-XH-A(LF)(SN)  [CONN-TH_B2B-XH-A-LF-SN]  4.06 51.05 270 top
R1  22Ω  [R0603]  64.52 41.91 0 top
R2  100Ω  [R0603]  12.45 19.05 90 top
R3  100Ω  [R0603]  12.45 29.46 270 top
R4  100Ω  [R0603]  12.45 24.89 270 top
R5  100Ω  [R0603]  12.45 14.48 270 top
R6  100Ω  [R0603]  12.45 9.91 270 top
R7  100Ω  [R0603]  12.45 34.04 90 top
R8  1kΩ  [R0603]  8.38 43.94 180 top
R9  4.7kΩ  [R0603]  64.52 43.94 180 top
R10  4.7kΩ  [R0603]  26.16 21.84 90 top
R11  4.7kΩ  [R0603]  26.16 17.02 270 top
R12  10kΩ  [R0603]  16.51 40.39 180 top
R13  10kΩ  [R0603]  67.82 4.32 90 top
R14  10kΩ  [R0603]  13.21 40.39 180 top
R15  10kΩ  [R0603]  14.73 9.91 270 top
R16  10kΩ  [R0603]  14.73 19.05 90 top
R17  10kΩ  [R0603]  14.73 24.89 90 top
R18  10kΩ  [R0603]  14.73 34.04 90 top
R19  10kΩ  [R0603]  8.89 37.85 270 top
SW1  TS-1088-AR02016  [SW-SMD_L3.9-W3.0-P4.45]  3.81 39.88 0 top
SW2  TS-1088-AR02016  [SW-SMD_L3.9-W3.0-P4.45]  72.14 10.16 180 top
TVS1  SMBJ6.0A  [SMB_L4.5-W3.7-LS5.4-RD]  20.57 55.12 0 top
TVS2  SMAJ5.0CA  [SMA_L4.3-W2.6-LS5.0-BI]  17.53 33.02 270 top
TVS3  SMAJ5.0CA  [SMA_L4.3-W2.6-LS5.0-BI]  17.53 25.91 90 top
TVS4  SMAJ5.0CA  [SMA_L4.3-W2.6-LS5.0-BI]  17.53 18.03 270 top
TVS5  SMAJ5.0CA  [SMA_L4.3-W2.6-LS5.0-BI]  17.53 10.92 90 top
TVS6  SMAJ5.0CA  [SMA_L4.3-W2.6-LS5.0-BI]  70.87 42.93 180 top
U1_A1  KH-2.54FH-1X16P-H8.5  [HDR-TH_16P-P2.54-V-F-B]  59.94 32 270 top
U1_A2  KH-2.54FH-1X16P-H8.5  [HDR-TH_16P-P2.54-V-F-B]  29.46 32 90 top
U1_B1  KH-2.54FH-1X20P-H8.5  [HDR-TH_20P-P2.54-V-F-2]  57.4 26.92 270 top
U1_B2  KH-2.54FH-1X20P-H8.5  [HDR-TH_20P-P2.54-V-F-2]  32 26.92 90 top
U2  ADS1115IDGST  [VSSOP-10_L3.0-W3.0-P0.50-LS4.9-BL]  21.34 21.84 180 top
U3  DS18B20U(UMW)  [MSOP-8_L3.0-W3.0-P0.65-LS4.9-BL]  66.04 47.24 270 top

## Footprints (pads in the part's own frame, mm; a bottom-side part is the same pattern mirrored in y, then rotated)
AUDIO-TH_PJ307C
  oval 2x1.2 hole 1.5x0.8: 1(0,2.5)
  oval 1.2x2 hole 0.8x1.5: 2(5,-2.5) 3(2.489,-2.5) 4(-2.511,-2.5) 5(-5,-2.5)
C0603
  rect 0.8x0.9 smd: 1(-0.7,0) 2(0.7,0)
C1206
  rect 1.485x1.728 smd: 1(-1.593,0) 2(1.593,0)
CONN-TH_3P-P2.50_A2501WV2-3P
  round 1.55 hole 0.9: 1(-2.5,0) 2(0,0) 3(2.5,0)
CONN-TH_B2B-XH-A-LF-SN
  round 1.7 hole 1: 1(1.25,0) 2(-1.25,0)
F1206
  rect 1.19x1.728 smd: 1(-1.445,0) 2(1.445,0)
HDR-TH_16P-P2.54-V-F-B
  rect 1.6x1.6 hole 1: 1(-19.05,0)
  round 1.6 hole 1: 2(-16.51,0) 3(-13.97,0) 4(-11.43,0) 5(-8.89,0) 6(-6.35,0) 7(-3.81,0) 8(-1.27,0) 9(1.27,0) 10(3.81,0) 11(6.35,0) 12(8.89,0) 13(11.43,0) 14(13.97,0) 15(16.51,0) 16(19.05,0)
HDR-TH_20P-P2.54-V-F-2
  rect 1.65x1.65 hole 1.02: 1(-24.13,0)
  round 1.65 hole 1.02: 2(-21.59,0) 3(-19.05,0) 4(-16.51,0) 5(-13.97,0) 6(-11.43,0) 7(-8.89,0) 8(-6.35,0) 9(-3.81,0) 10(-1.27,0) 11(1.27,0) 12(3.81,0) 13(6.35,0) 14(8.89,0) 15(11.43,0) 16(13.97,0) 17(16.51,0) 18(19.05,0) 19(21.59,0) 20(24.13,0)
LED0805-R-RD
  rect 1x1.399 smd: 1(1.05,0) 2(-1.05,0)
MSOP-8_L3.0-W3.0-P0.65-LS4.9-BL
  rect 0.406x1.397 smd: 1(-0.975,-2.3) 2(-0.325,-2.3) 3(0.325,-2.3) 4(0.975,-2.3) 5(0.975,2.3) 6(0.325,2.3) 7(-0.325,2.3) 8(-0.975,2.3)
Pad_e360
  round 0.61 smd: TP1(0,0)
R0603
  rect 0.806x0.864 smd: 1(-0.753,0) 2(0.753,0)
SMA_L4.3-W2.6-LS5.0-BI
  rect 2x2 smd: 1(-2.2,0) 2(2.2,0)
SMA_L4.3-W2.6-LS5.2-RD
  rect 2x2 smd: 1(-2.2,0) 2(2.2,0)
SMB_L4.5-W3.7-LS5.4-RD
  rect 2.047x2.192 smd: 1(-2.361,0) 2(2.361,0)
SW-SMD_L3.9-W3.0-P4.45
  rect 1.23x1.86 smd: 1(-2.185,0) 2(2.185,0)
VSSOP-10_L3.0-W3.0-P0.50-LS4.9-BL
  rect 0.3x1.3 smd: 1(-1,-2.35) 2(-0.5,-2.35) 3(0,-2.35) 4(0.5,-2.35) 5(1,-2.35) 6(1,2.35) 7(0.5,2.35) 8(0,2.35) 9(-0.5,2.35) 10(-1,2.35)

## Nets
As in the schematic, except:
DC5: NOREF.TP1 U1_A1.1

Pads without a net: J1A 2 3 4; J2A 2 3 4; U1_A2 7 8 9; U1_B2 10 11 12; U3 2 3 5 6 7

## Via types
v1: diameter 0.61, hole 0.305, Top Layer to Bottom Layer, 101 vias

## Routing (per net, layer and track width the routed paths; a pad name or vN(x,y) marks a point on that pad's centre or on a via; arc(x,y) is an arc through that point)
3V3: length 86.3
  Top Layer w0.254: 10.68,38.58 10.66,38.6 R19.1 ; C2.2 22.34,24.19 U2.1
  Top Layer w0.305: R13.1 66.98,2.73 C11.1 ; U1_A2.2 26.93,15.49 R11.2 ; C5.2 66.08,13.72 J3D.3 ; R9.2 v1(62.23,43.94) ; U2.8 21.38,19.54 21.38,20.27 22.34,21.22 U2.1 22.35,24.21 v1(22.35,25.36) ; R10.2 26.16,23.11 25.08,24.19 C2.2 ; U3.8 70.84,48.22 C6.2 v1(72.64,47.94)
  Top Layer w0.508: LED1.1 v1(2.51,46.74) ; R7.2 11.69,34.79 10.68,35.81 v1(10.68,40.39) R14.2 ; R2.2 v1(12.45,21.34)
  Top Layer w0.635: J3A.3 J3B.3 J3C.3 J3D.3 ; 29.46,15.39 29.46,12.77 C10.1 ; 59.94,2.79 59.94,12.85 ; 59.94,2.79 64.77,2.79 C11.1 ; 59.94,2.79 U1_B1.20
GND: length 2.9
  Top Layer w0.305: 22.35,26.67 21.34,25.65 U2.3
  vias: v1(5.44,61.32) v1(5.44,51.16) v1(5.44,46.08) v1(5.44,35.92) v1(5.44,20.68) v1(5.44,10.52) v1(10.52,61.32) v1(10.52,51.16) v1(10.52,46.08) v1(10.52,30.84) v1(10.52,25.76) v1(10.52,20.68) v1(10.52,15.6) v1(10.52,10.52) v1(10.52,5.44) v1(15.6,61.32) v1(15.6,56.24) v1(15.6,46.08) v1(15.6,35.92) v1(15.6,5.44) v1(17.54,25.89) v1(17.53,18.03) v1(20.32,21.42) v1(20.68,61.32) v1(20.68,56.24) v1(20.68,46.08) v1(20.68,35.92) v1(20.68,30.84) v1(20.68,10.52) v1(20.68,5.44) v1(25.76,61.32) v1(25.76,56.24) v1(25.76,41) v1(25.76,30.84) v1(25.76,25.76) v1(25.76,5.44) v1(30.84,61.32) v1(30.84,56.24) v1(35.92,61.32) v1(35.92,56.24) v1(35.92,51.16) v1(35.92,46.08) v1(35.92,41) v1(35.92,35.92) v1(35.92,30.84) v1(35.92,25.76) v1(35.92,20.68) v1(41,61.32) v1(41,56.24) v1(41,51.16) v1(41,46.08) v1(41,41) v1(41,35.92) v1(41,30.84) v1(41,25.76) v1(41,20.68) v1(46.08,61.32) v1(46.08,56.24) v1(46.08,51.16) v1(46.08,46.08) v1(46.08,41) v1(46.08,35.92) v1(46.08,30.84) v1(46.08,25.76) v1(46.08,20.68) v1(51.16,61.32) v1(51.16,56.24) v1(51.16,51.16) v1(51.16,46.08) v1(51.16,41) v1(51.16,35.92) v1(51.16,30.84) v1(51.16,25.76) v1(51.16,20.68) v1(56.24,61.32) v1(56.24,56.24) v1(61.32,61.32) v1(61.32,56.24) v1(61.32,10.52) v1(66.4,61.32) v1(66.4,56.24) v1(66.4,51.16) v1(66.4,46.08) v1(66.4,41) v1(71.48,56.24) v1(71.48,51.16) v1(71.48,41) v1(71.48,25.76) v1(71.48,20.68) v1(71.48,15.6) v1(71.48,10.52)
VCC: length 8.9
  Top Layer w0.635: PWR_IN.2 4.06,54.1 6.86,56.9 9.98,56.9
(no net): length 10.8
  Inner1 w0.305: U1_A2.7 U1_B2.10 ; U1_A2.9 U1_B2.12 ; U1_A2.8 U1_B2.11
1W_1: length 36
  Top Layer w0.305: U3.1 64.77,48.22 65.27,47.72 R9.1 65.27,42.93 ; 65.27,42.93 R1.2 ; 65.27,42.93 68.58,42.93
  Top Layer w0.635: 68.58,42.93 J3A.2 J3B.2 J3C.2 J3D.2
AIN0_1: length 17.4
  Top Layer w0.305: R18.1 14.73,30.82 ; 14.73,30.82 C3.2 14.68,30.22 R3.1 ; 14.73,30.82 TVS2.2 19.47,30.82 20.83,29.46 20.83,24.2 U2.4
AIN1_1: length 14.4
  Top Layer w0.305: 14.73,28.11 R17.2 R4.1 ; 14.73,28.11 C3.1 ; 14.73,28.11 TVS3.2 19.39,28.11 20.32,27.18 20.32,24.21 U2.5
AIN2_1: length 14.1
  Top Layer w0.305: 14.73,15.83 TVS4.2 19.39,15.83 20.32,16.76 20.32,19.48 U2.6 ; 14.73,15.83 R16.1 ; 14.73,15.83 C4.2 14.68,15.23 R5.1
AIN3_1: length 16.9
  Top Layer w0.305: R6.1 R15.1 14.73,13.12 ; U2.7 20.83,19.49 20.83,14.73 19.22,13.12 TVS5.2 14.73,13.12 ; 14.73,13.12 C4.1
IN0_1: length 9.6
  Top Layer w0.305: R3.2 11.93,28.19 7.37,28.19 J1B.2 J1A.1
IN1_1: length 7.5
  Top Layer w0.305: R4.2 8.92,24.14 J1A.5 J1B.3
IN2_1: length 9.6
  Top Layer w0.305: R5.2 11.93,13.21 7.37,13.21 J2B.2 J2A.1
IN3_1: length 7.5
  Top Layer w0.305: R6.2 8.92,9.15 J2A.5 J2B.3
IO0: length 36.5
  Top Layer w0.254: R19.2 8.88,37.08 C13.2 6.03,39.84 SW1.2
  Top Layer w0.305: SW1.2 6.25,40.13 7.13,40.13 8.38,41.39 8.38,41.39 9.41,42.42 19.3,42.42 25.91,35.81 U1_A2.10
  Inner1 w0.305: U1_A2.10 U1_B2.13
IO1: length 19.8
  Top Layer w0.305: 31.75,7.87 30.73,8.89 30.73,16.66 29.46,17.93 22.45,17.93 21.84,18.55 U2.9
IO2: length 19.7
  Top Layer w0.305: U2.10 22.34,20.3 23.11,21.08 28.85,21.08 29.46,20.47
  Inner1 w0.305: U1_B2.4 30.73,11.68 30.73,19.3 U1_A2.4
IO3: length 3.6
  Inner1 w0.305: U1_B1.9 U1_A1.10
IO8: length 3.6
  Inner1 w0.305: U1_B1.10 U1_A1.11
IO9: length 15
  Top Layer w0.305: U1_A1.8 61.98,33.27 63.76,35.06 R1.1
  Inner1 w0.305: U1_B1.7 U1_A1.8
IO10: length 3.6
  Inner1 w0.305: U1_B1.6 U1_A1.7
IO11: length 3.6
  Inner1 w0.305: U1_B1.5 U1_A1.6
IO12: length 3.6
  Inner1 w0.305: U1_B1.4 U1_A1.5
IO13: length 3.6
  Inner1 w0.305: U1_B1.3 U1_A1.4
IO14: length 3.6
  Inner1 w0.305: U1_B1.2 U1_A1.3
IO16: length 3.6
  Inner1 w0.305: U1_B1.13 U1_A1.14
IO17: length 3.6
  Inner1 w0.305: U1_B1.12 U1_A1.13
IO18: length 3.6
  Inner1 w0.305: U1_B1.11 U1_A1.12
IO21: length 24.8
  Top Layer w0.305: U1_A2.14 22.1,45.97 20.07,43.94 R8.1
  Inner1 w0.305: U1_A2.14 U1_B2.17
IO45: length 3.6
  Inner1 w0.305: U1_A2.11 U1_B2.14
IO46: length 3.6
  Inner1 w0.305: U1_B1.8 U1_A1.9
IO47: length 3.6
  Inner1 w0.305: U1_A2.13 U1_B2.16
IO48: length 3.6
  Inner1 w0.305: U1_A2.12 U1_B2.15
P1_1: length 6.9
  Top Layer w0.305: R7.1 12.44,33.27 7.37,33.27 6.1,32 J1B.1
P2_1: length 6.9
  Top Layer w0.305: R2.1 7.41,18.3 J2B.1
RST: length 20.4
  Top Layer w0.254: R13.2 v1(67.82,6.35) 67.82,10.14 67.8,10.16 ; C14.2 67.8,10.16 ; 67.8,10.16 SW2.2
  Inner1 w0.305: v1(67.82,6.35) 66.8,5.33 U1_B1.19
RXD: length 23.6
  Top Layer w0.305: U1_A2.6 30.73,24.38 32.77,24.38 33.27,23.88 33.27,6.6 U1_B2.2
TXD: length 23.6
  Inner1 w0.305: U1_B2.1 33.27,4.06 33.27,21.34 32.77,21.84 30.73,21.84 U1_A2.5
VMID: length 42.8
  Top Layer w0.305: 14.73,38.1 v1(14.73,36.58) R18.2 ; 14.73,38.1 C8.2 ; 14.73,38.1 14.73,40.39 ; 14.73,40.39 R14.1 ; 14.73,40.39 R12.2 ; R16.2 v1(14.73,22.23) R17.1 ; R15.2 v1(14.73,7.87)
  Inner1 w0.305: v1(14.73,36.58) v1(14.73,22.23) v1(14.73,7.87)
VSYS: length 46.9
  Top Layer w0.635: U1_A2.16 29.46,50.95 14.58,50.95 14.14,51.39 D1.1
  Inner1 w0.635: U1_A2.16 31.75,53.34 55.12,53.34 U1_B1.1
$1N10138: length 6.1
  Top Layer w0.635: F1.2 11.68,55.7 11.68,53.59 10.92,52.83 D1.2
$1N10539: length 3
  Top Layer w0.305: LED1.2 R8.2

## Copper pours and planes (outline as drawn; the poured copper is in the pictures)
3V3 on Inner2: 0,0 76.2,0 76.2,63.5 0,63.5
GND on Top Layer: 0,63.5 76.2,63.5 76.2,0 0,0
GND on Bottom Layer: 0,0 76.2,0 76.2,63.5 0,63.5
GND on Inner1: 0,0 76.2,0 76.2,63.5 0,63.5
VSYS on Top Layer: 12.82,54.26 15.39,54.26 15.39,47.49 12.82,47.49

## Text on the board
Top Silkscreen Layer: thesada.io / base carrier v0.2
